# Altium schematic sheet ffultra_p2_channel.SchDoc
size A4; SheetNumber: 12; SheetTotal: 13
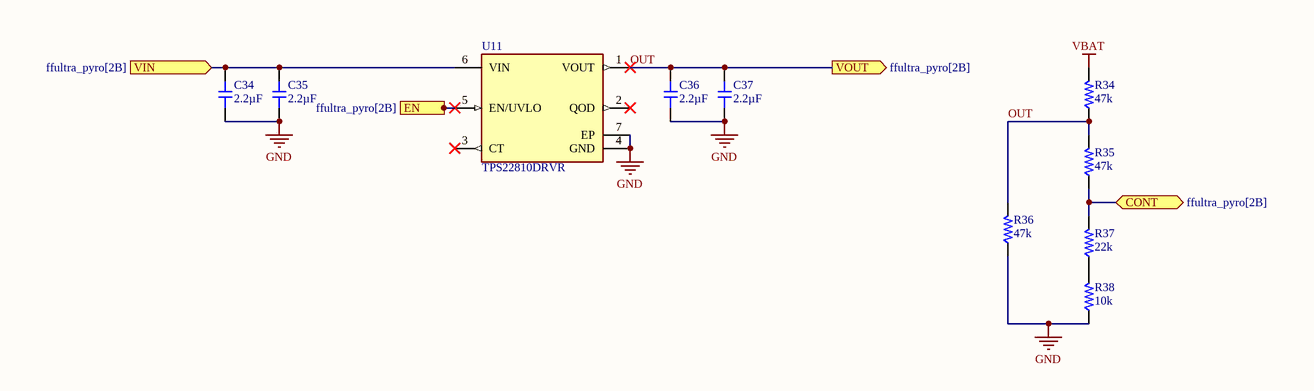
[diagram p0: ffultra_p2_channel.SchDoc]

## Parts
C34  value 2.2µF  [CAP-0402]  (hidden comment: CL05A225MQ5NSNC)
C35  value 2.2µF  [CAP-0402]  (hidden comment: CL05A225MQ5NSNC)
C36  value 2.2µF  [CAP-0402]  (hidden comment: CL05A105KA5NQNC)
C37  value 2.2µF  [CAP-0402]  (hidden comment: CL05A105KA5NQNC)
R34  value 47k  [RES-0402]  (hidden comment: 0402WGF4702TCE)
R35  value 47k  [RES-0402]  (hidden comment: 0402WGF4702TCE)
R36  value 47k  [RES-0402]  (hidden comment: 0402WGF4702TCE)
R37  value 22k  [RES-0402]  (hidden comment: 0402WGF2202TCE)
R38  value 10k  [RES-0402]  (hidden comment: 0402WGF1002TCE)
U11  TPS22810DRVR  [FP-DRV0006A-IPC_A]

## Ports
CONT (bidir, see ffultra_pyro[2B]), EN (in, see ffultra_pyro[2B]), VIN (in, see ffultra_pyro[2B]), VOUT (out, see ffultra_pyro[2B])

## Nets
GND: C34.1 C35.1 C36.1 C37.1 R36.1 R38.1 U11.4(GND) U11.7(EP)
VBAT: R34.2
CONT: R35.1 R37.2 ; port CONT
EN: U11.5(EN/UVLO) ; port EN
OUT: C36.2 C37.2 R34.1 R35.2 R36.2 U11.1(VOUT) ; port VOUT
VIN: C34.2 C35.2 U11.6(VIN) ; port VIN
NetR37_1: R37.1 R38.2

Not connected (* = marked no-connect by the designer): U11 2(QOD)* 3(CT)*

## Library data of the parts
C34 C35 = CMP-001-00137-1: Capacitor, Ceramic (MLCC), 2.2uF, ±20%, 6.3V, X5R, ±20%, SMD 0402; Manufacturer: Samsung Electro-Mechanics; Voltage Rating: 6.3V; ComponentLink3Description: LCSC Part URL; JLCPCB Basic Part: Yes; JLCPCB Part Number: C12530; ComponentLink1URL: https://datasheet.lcsc.com/lcsc/1811021410_Samsung-Electro-Mechanics-CL05A225MQ5NSNC_C12530.pdf; Tolerance: 20%; Category: Capacitors - MLCC; Source: jlcpcb_capacitors_basic.schlib; ComponentLink2URL: https://jlcpcb.com/partdetail/C12530; ComponentLink3URL: https://lcsc.com/product-detail/Multilayer-Ceramic-Capacitors-MLCC---SMD-SMT_Samsung-Electro-Mechanics-Samsung-Electro-Mechanics-CL05A225MQ5NSNC_C12530.html; ComponentLink2Description: JLCPCB Part URL; Manufacturer Part Number: CL05A225MQ5NSNC; Temperature Coefficient: X5R; RoHS: Yes; ComponentLink1Description: Datasheet; Design Item ID: CL05A225MQ5NSNC; Case/Package: 0402
C36 C37 = CMP-001-00135-1: Capacitor, Ceramic (MLCC), 1uF, ±10%, 25V, X5R, ±10%, SMD 0402; Manufacturer: Samsung Electro-Mechanics; Voltage Rating: 25V; RoHS: Yes; Temperature Coefficient: X5R; Tolerance: 10%; Source: jlcpcb_capacitors_basic.schlib; ComponentLink1URL: https://datasheet.lcsc.com/lcsc/1811091611_Samsung-Electro-Mechanics-CL05A105KA5NQNC_C52923.pdf; JLCPCB Basic Part: Yes; ComponentLink1Description: Datasheet; ComponentLink2URL: https://jlcpcb.com/partdetail/C52923; Case/Package: 0402; ComponentLink3Description: LCSC Part URL; Manufacturer Part Number: CL05A105KA5NQNC; ComponentLink3URL: https://lcsc.com/product-detail/Multilayer-Ceramic-Capacitors-MLCC---SMD-SMT_Samsung-Electro-Mechanics-Samsung-Electro-Mechanics-CL05A105KA5NQNC_C52923.html; Design Item ID: CL05A105KA5NQNC; JLCPCB Part Number: C12530; ComponentLink2Description: JLCPCB Part URL; Category: Capacitors - MLCC
R34-R36 = CMP-009-00229-1: Resistor, 47kΩ, ±1%, 62.5mW, 50V, ±100ppm/℃, -55℃~+155℃, SMD 0402; Manufacturer: Uniroyal; Voltage Rating: 50V; ComponentLink2URL: https://jlcpcb.com/partdetail/C25792; ComponentLink1Description: Datasheet; Design Item ID: 0402WGF4702TCE; JLCPCB Part Number: C25792; Tolerance: 1%; Power Rating: 62.5mW; Temperature Coefficient: ±100ppm/℃; Temperature Rating: -55℃~+155℃; ComponentLink2Description: JLCPCB Part URL; Source: jlcpcb_resistors_basic.schlib; Case/Package: 0402; ComponentLink1URL: https://datasheet.lcsc.com/lcsc/2206010100_UNI-ROYAL-Uniroyal-Elec-0402WGF4702TCE_C25792.pdf; JLCPCB Basic Part: Yes; Manufacturer Part Number: 0402WGF4702TCE; Category: Resistors
R37 = CMP-009-00212-1: Resistor, 22kΩ, ±1%, 62.5mW, 50V, ±100ppm/℃, -55℃~+155℃, SMD 0402; Manufacturer: Uniroyal; Temperature Coefficient: ±100ppm/℃; Power Rating: 62.5mW; ComponentLink1URL: https://datasheet.lcsc.com/lcsc/2206010100_UNI-ROYAL-Uniroyal-Elec-0402WGF2202TCE_C25768.pdf; ComponentLink1Description: Datasheet; Manufacturer Part Number: 0402WGF2202TCE; Tolerance: 1%; Category: Resistors; Temperature Rating: -55℃~+155℃; Case/Package: 0402; Source: jlcpcb_resistors_basic.schlib; Voltage Rating: 50V; ComponentLink2Description: JLCPCB Part URL; ComponentLink2URL: https://jlcpcb.com/partdetail/C25768; Design Item ID: 0402WGF2202TCE; JLCPCB Basic Part: Yes; JLCPCB Part Number: C25768
R38 = CMP-009-00191-1: Resistor, 10kΩ, ±1%, 62.5mW, 50V, ±100ppm/℃, -55℃~+155℃, SMD 0402; Manufacturer: Uniroyal; Temperature Rating: -55℃~+155℃; ComponentLink1URL: https://datasheet.lcsc.com/lcsc/2206010100_UNI-ROYAL-Uniroyal-Elec-0402WGF1002TCE_C25744.pdf; Source: jlcpcb_resistors_basic.schlib; Tolerance: 1%; Design Item ID: 0402WGF1002TCE; ComponentLink1Description: Datasheet; ComponentLink2URL: https://jlcpcb.com/partdetail/C25744; Category: Resistors; JLCPCB Part Number: C25744; ComponentLink2Description: JLCPCB Part URL; Temperature Coefficient: ±100ppm/℃; JLCPCB Basic Part: Yes; Power Rating: 62.5mW; Case/Package: 0402; Voltage Rating: 50V; Manufacturer Part Number: 0402WGF1002TCE
U11 = CMP-019-00059-2: Buffer/Inverter Based Peripheral Driver, 1 Driver, PDSO6; Min Supply Voltage: 2.7V; Max Supply Voltage: 18V; RoHS Compliant: Yes; Height - Seated (Max): 0.8mm; Max Operating Temperature: 105°C; JLCPCB Part Number: C527679; Min Operating Temperature: -40°C; JESD-30 Code: S-PDSO-N6; Pins: 6; Case/Package: VSON